# Altium schematic sheet Power supply.SchDoc
size A4; Date: 11/15/2026; SheetNumber: 2; SheetTotal: 2
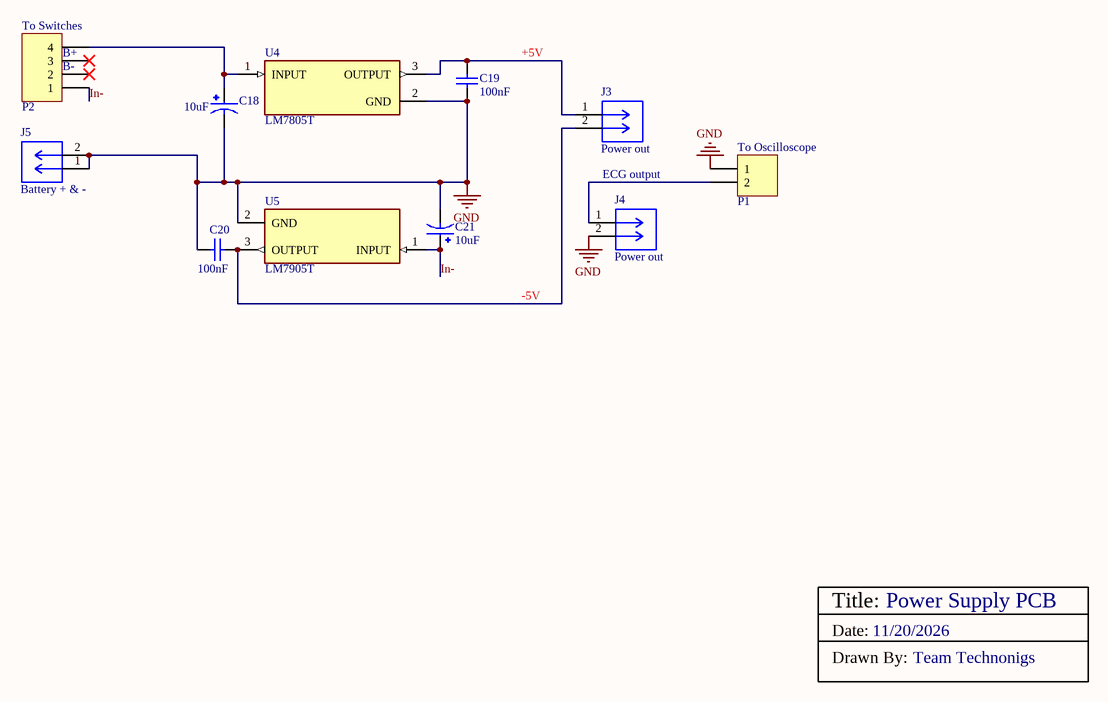
[diagram p0: Power supply.SchDoc]

## Parts
C18  10uF  [10uF capacitor]
C19  100nF  [100nF capacitor]
C20  100nF  [100nF capacitor]
C21  10uF  [10uF capacitor]
J3  Power out  [My_CN2]
J4  Power out  [My_CN2]
J5  Battery + & -  [My_CN2]
P1  To Oscilloscope  [My_1X02]
P2  To Switches  [My_1X04]
U4  LM7805T  [TO254P1011X457X1950-3]
U5  LM7905T  [TO254P1011X457X1950-3]

## Nets
GND: C18.N C19.1 C20.1 C21.N J4.2 J5.1 J5.2 P1.1 U4.2(GND) U5.2(GND)
In-: C21.P P2.1 U5.1(INPUT)
NetC18_P: C18.P P2.4 U4.1(INPUT)
NetC19_2: C19.2 J3.1 U4.3(OUTPUT)
NetC20_2: C20.2 J3.2 U5.3(OUTPUT)
NetJ4_1: J4.1 P1.2

Not connected (* = marked no-connect by the designer): P2 2* 3*

## Notes on the sheet
- (near P2) B+
- +5V
- (near P2) B-
- ECG output
- -5V
- Title:
- Date:
- Drawn By:
- 11/20/2026
- Power Supply PCB
- Team Technonigs

## Library data of the parts
C18 C21 = 10uF capacitor
J3-J5 = 2 terminal block: Conn Eurostyle Block 2 POS 5.08mm Solder ST Thru-Hole 15A/Contact Eurostyleâ„¢; MF: Molex; MP: 395943002; SnapEDA_Link: https://www.snapeda.com/parts/395943002/Molex/view-part/?ref=snap; Package: None; Value: *; Check_prices: https://www.snapeda.com/parts/395943002/Molex/view-part/?ref=eda
P1 = Header 2: Header, 2-Pin; ASiD Part Number: Header 2-AS
P2 = Header 4: Header, 4-Pin; ASiD Part Number: Header 4-AS
U4 U5 = LM7805T: 3-Terminal 1.5A Positive Fixed Voltage Regulator; MF: TAEJIN; SnapEDA_Link: https://www.snapeda.com/parts/LM7805T/TAEJIN/view-part/?ref=snap; Package: TO-220-3 TAEJIN; Value: *; MP: LM7805T; Check_prices: https://www.snapeda.com/parts/LM7805T/TAEJIN/view-part/?ref=eda
C19 C20 = 100nF: ComponentLink1Description: New link; ComponentLink1URL: *